# Altium schematic sheet BlockDiagram.SchDoc
size A3; SheetNumber: 2; SheetTotal: 7
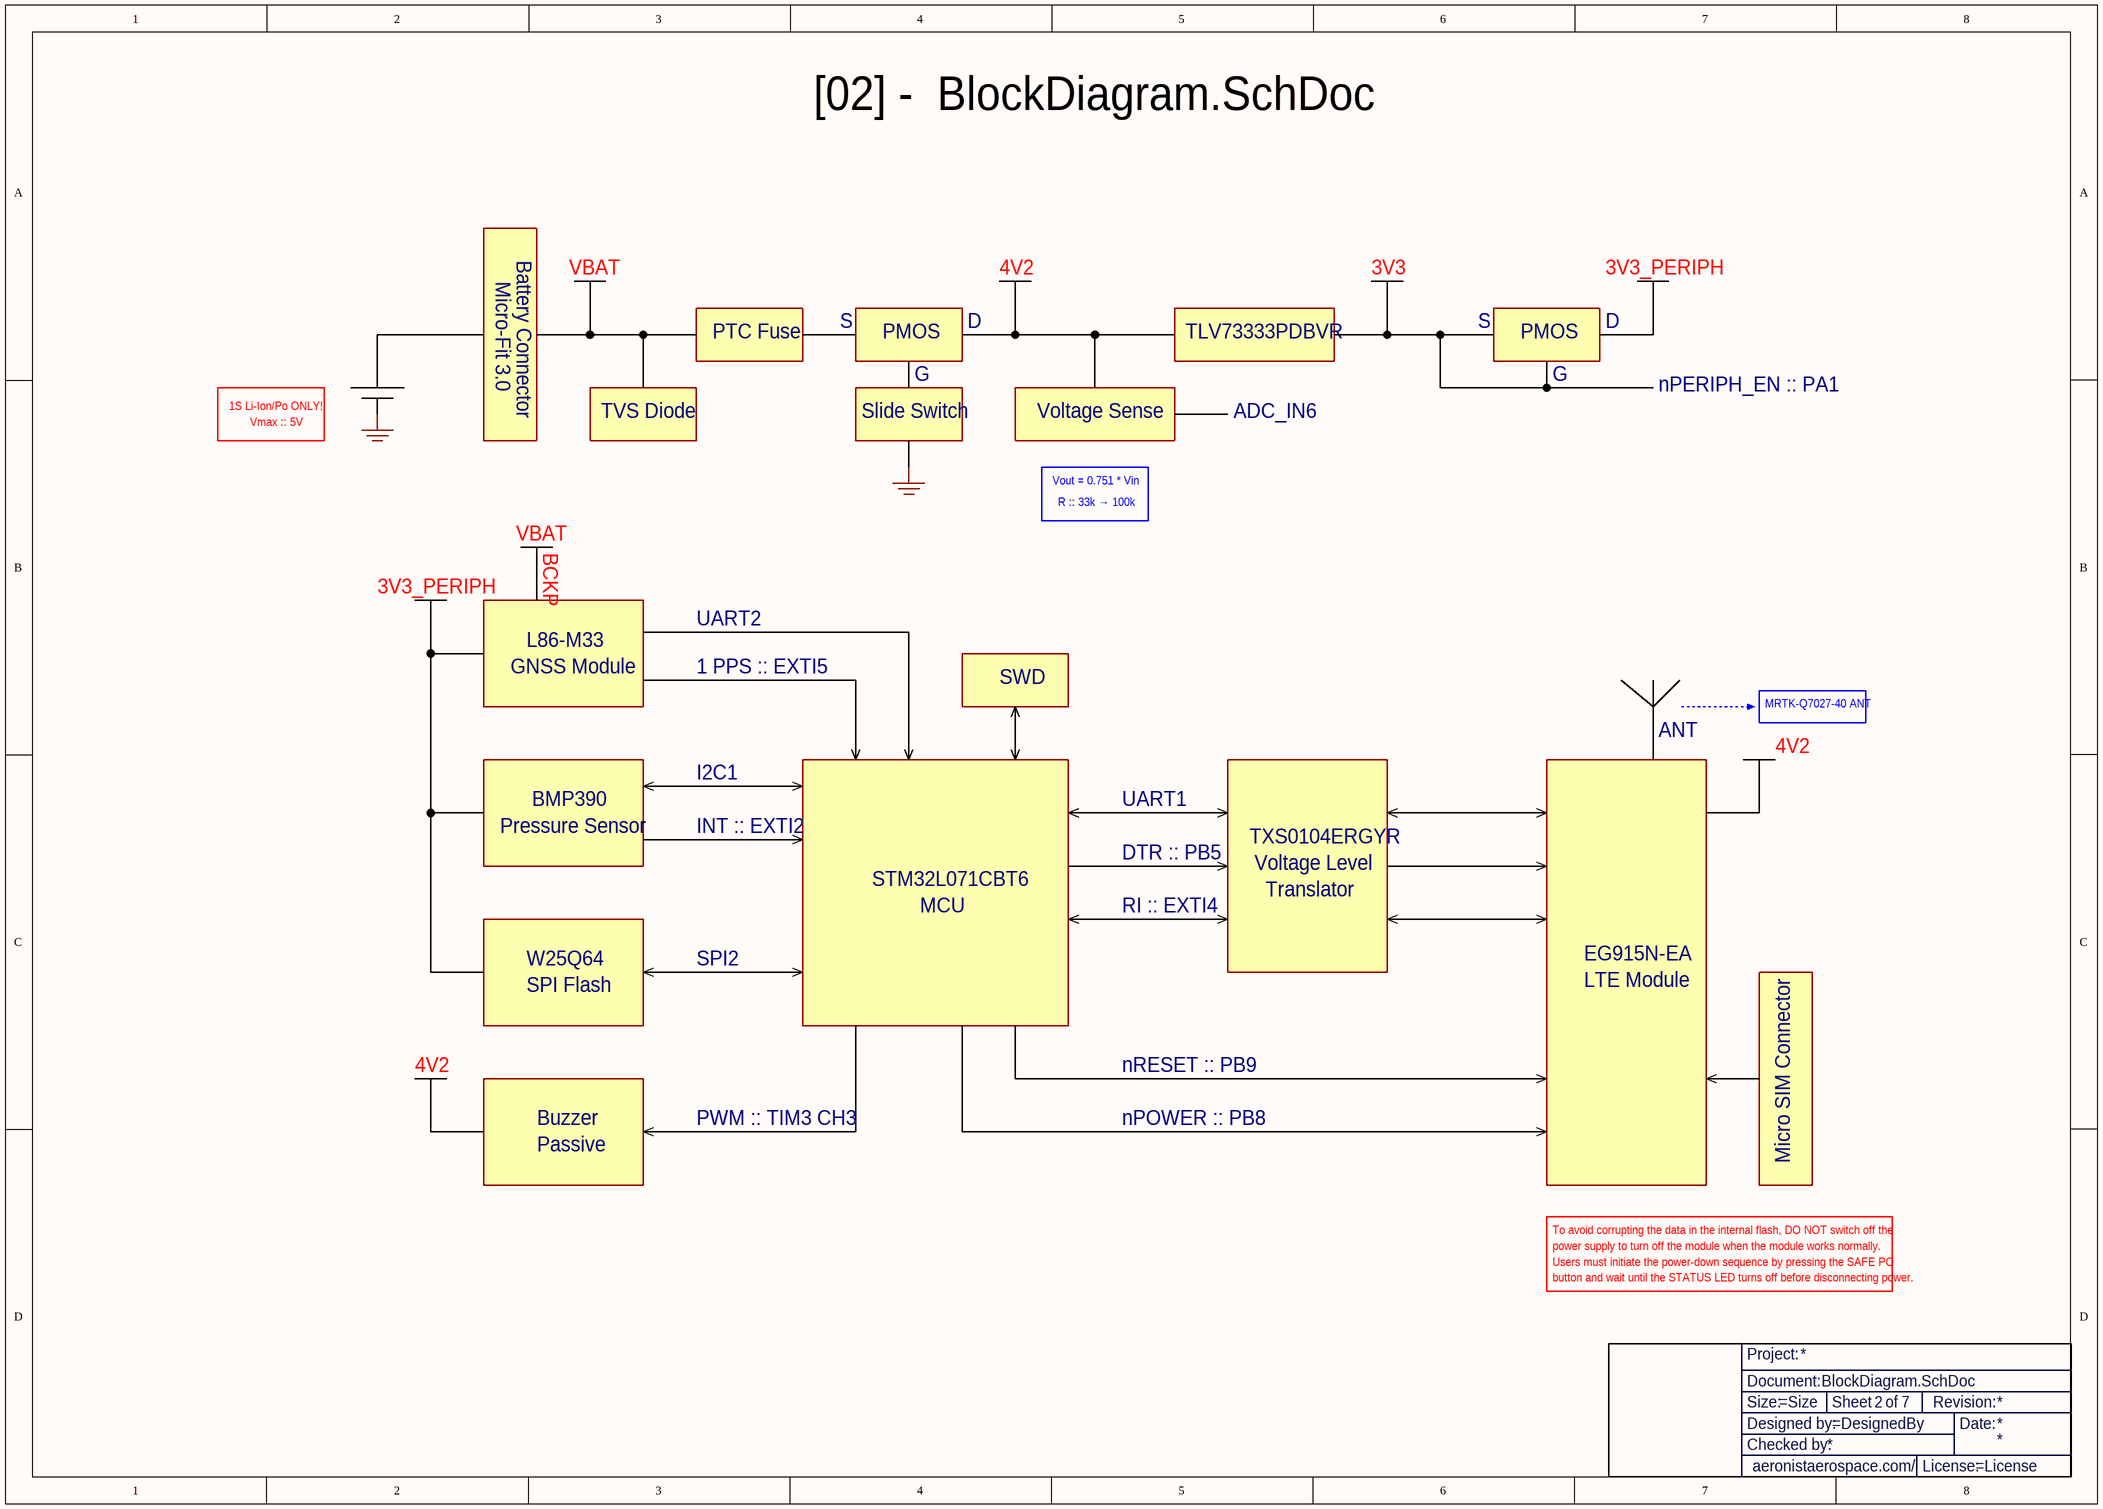
[diagram p0: BlockDiagram.SchDoc]

## Parts
?  Title Block  (value not drawn)  (graphical)

## Notes on the sheet
- [02] -  BlockDiagram.SchDoc
- Micro-Fit 3.0
- Battery Connector
- VBAT
- 4V2
- 3V3
- 3V3_PERIPH
- PTC Fuse
- S
- PMOS
- G
- D
- TLV73333PDBVR
- 1S Li-Ion/Po ONLY!
- Vmax :: 5V
- TVS Diode
- Slide Switch
- Voltage Sense
- ADC_IN6
- nPERIPH_EN :: PA1
- Vout = 0.751 * Vin
- R :: 33k → 100k
- BCKP
- L86-M33
- UART2
- GNSS Module
- 1 PPS :: EXTI5
- SWD
- MRTK-Q7027-40 ANT
- I2C1
- ANT
- Pressure Sensor
- BMP390
- INT :: EXTI2
- UART1
- TXS0104ERGYR
- STM32L071CBT6
- MCU
- DTR :: PB5
- RI :: EXTI4
- Voltage Level
- Translator
- W25Q64
- SPI2
- EG915N-EA
- LTE Module
- SPI Flash
- Buzzer
- PWM :: TIM3 CH3
- nRESET :: PB9
- nPOWER :: PB8
- Passive
- Micro SIM Connector
- To avoid corrupting the data in the internal flash, DO NOT switch off the
- power supply to turn off the module when the module works normally.
- Users must initiate the power-down sequence by pressing the SAFE PO
- button and wait until the STATUS LED turns off before disconnecting power.
- (in symbol Title Block) Project:; Document:; Size:; Sheet; of; Revision:; Designed by:; Date:; Checked by:; aeronistaerospace.com/; License: